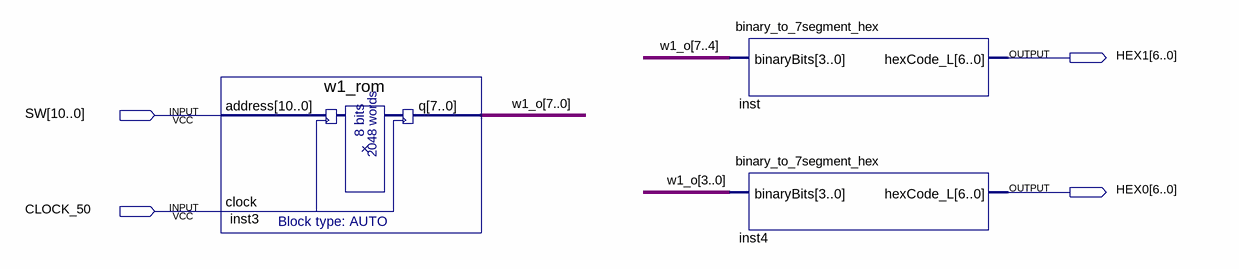
[diagram p0: schematic sheet]
// Quartus schematic silicio_ai_top.bdf as structural Verilog: 3 symbols, 4 pins
module silicio_ai_top (
  input  [10:0] SW,
  input  CLOCK_50,
  output [6:0] HEX1,
  output [6:0] HEX0
);

  wire [7:0] w1_o;

  w1_rom inst3 (.address(SW), .clock(CLOCK_50), .q(w1_o));
  binary_to_7segment_hex inst (.binaryBits(w1_o[7:4]), .hexCode_L(HEX1));
  binary_to_7segment_hex inst4 (.binaryBits(w1_o[3:0]), .hexCode_L(HEX0));
endmodule
